# Altium project Fairing_Avionics_Interface.PrjPcb (part 1 of 2)
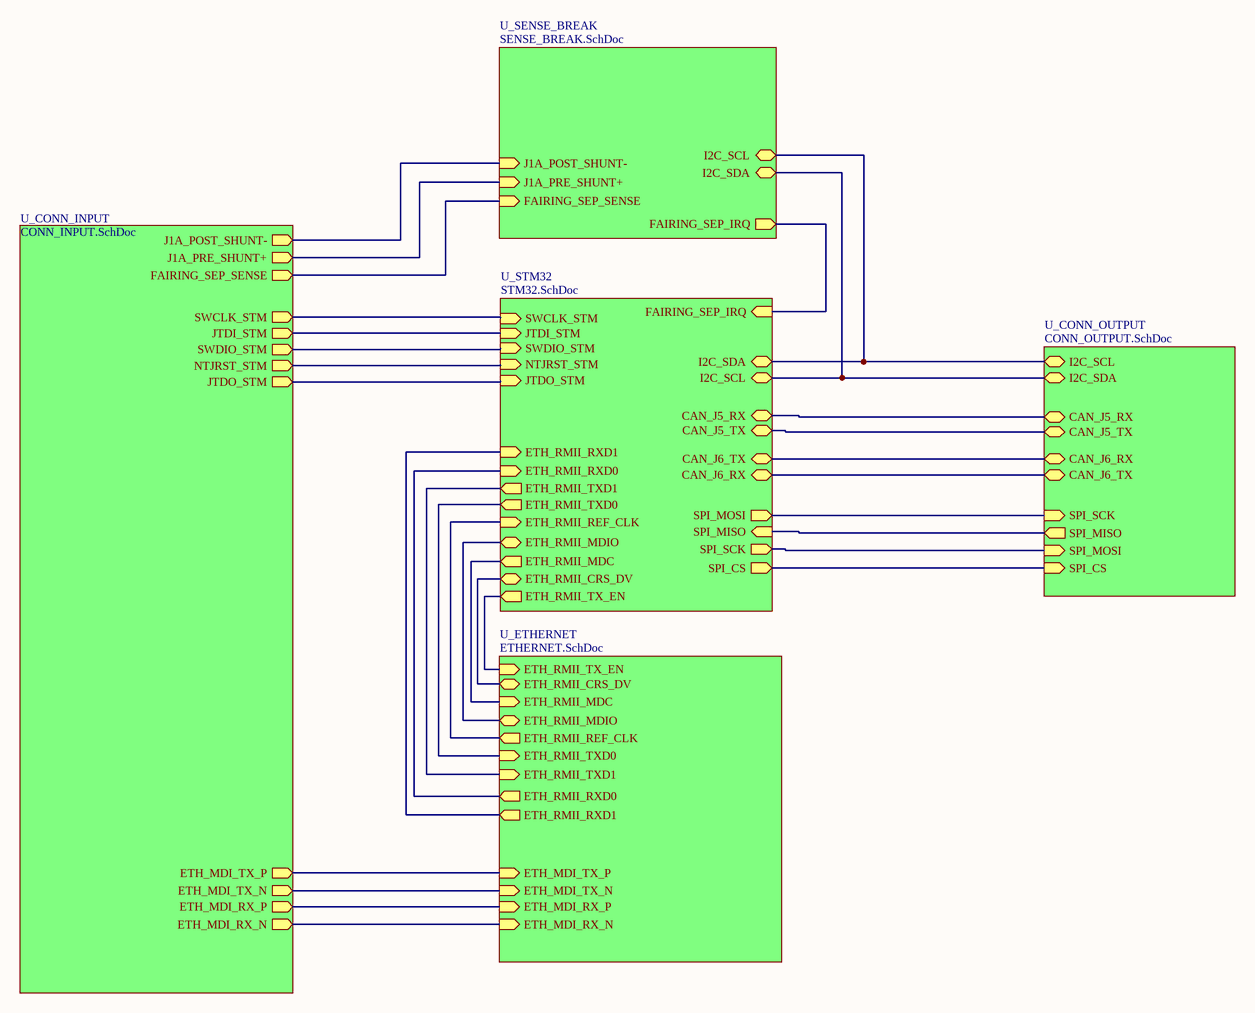
[diagram p0: [3]RootSheet.SchDoc]
6 sheets, 148 parts. Net scope: hierarchical (ports join the sheet entries above them; power ports are global).
Sheets:
  [3]RootSheet.SchDoc
    U_CONN_INPUT = CONN_INPUT.SchDoc
    U_ETHERNET = ETHERNET.SchDoc
    U_STM32 = STM32.SchDoc
    U_SENSE_BREAK = SENSE_BREAK.SchDoc
    U_CONN_OUTPUT = CONN_OUTPUT.SchDoc

## Sheet [3]RootSheet.SchDoc
size 431 x 279 mm; SheetNumber: 1; SheetTotal: 6

### Sub-sheets
U_CONN_INPUT = CONN_INPUT.SchDoc: FAIRING_SEP_SENSE (out), J1A_PRE_SHUNT+ (out), J1A_POST_SHUNT- (out), ETH_MDI_RX_N (out), ETH_MDI_RX_P (out), ETH_MDI_TX_N (out), ETH_MDI_TX_P (out), SWCLK_STM (out), JTDI_STM (out), SWDIO_STM (out), NTJRST_STM (out), JTDO_STM (out)
U_CONN_OUTPUT = CONN_OUTPUT.SchDoc: I2C_SCL (bidir), I2C_SDA (bidir), CAN_J5_TX (bidir), CAN_J5_RX (bidir), CAN_J6_RX (bidir), CAN_J6_TX (bidir), SPI_SCK (in), SPI_MISO (out), SPI_MOSI (in), SPI_CS (in)
U_ETHERNET = ETHERNET.SchDoc: ETH_RMII_TX_EN (in), ETH_MDI_TX_P (in), ETH_RMII_CRS_DV (bidir), ETH_RMII_MDIO (bidir), ETH_RMII_REF_CLK (out), ETH_RMII_TXD0 (in), ETH_RMII_TXD1 (in), ETH_MDI_RX_N (in), ETH_MDI_RX_P (in), ETH_MDI_TX_N (in), ETH_RMII_RXD0 (out), ETH_RMII_RXD1 (out), ETH_RMII_MDC (in)
U_SENSE_BREAK = SENSE_BREAK.SchDoc: I2C_SCL (bidir), J1A_PRE_SHUNT+ (in), J1A_POST_SHUNT- (in), FAIRING_SEP_SENSE (in), FAIRING_SEP_IRQ (out), I2C_SDA (bidir)
U_STM32 = STM32.SchDoc: FAIRING_SEP_IRQ (in), I2C_SDA (bidir), I2C_SCL (bidir), CAN_J5_TX (bidir), CAN_J6_RX (bidir), CAN_J6_TX (bidir), CAN_J5_RX (bidir), SPI_MOSI (out), SPI_SCK (out), SPI_CS (out), ETH_RMII_TX_EN (out), ETH_RMII_CRS_DV (bidir), ETH_RMII_MDC (out), ETH_RMII_MDIO (bidir), ETH_RMII_REF_CLK (in), ETH_RMII_TXD0 (out), ETH_RMII_TXD1 (out), ETH_RMII_RXD0 (in), ETH_RMII_RXD1 (in), SWCLK_STM (in), JTDI_STM (in), SWDIO_STM (in), NTJRST_STM (in), JTDO_STM (in), SPI_MISO (in)

### Nets
I2C_SCL: sheet U_STM32/I2C_SDA, sheet U_SENSE_BREAK/I2C_SCL, sheet U_CONN_OUTPUT/I2C_SCL
I2C_SDA: sheet U_STM32/I2C_SCL, sheet U_SENSE_BREAK/I2C_SDA, sheet U_CONN_OUTPUT/I2C_SDA
JTDO_STM: sheet U_CONN_INPUT/JTDO_STM, sheet U_STM32/JTDO_STM
NTJRST_STM: sheet U_CONN_INPUT/NTJRST_STM, sheet U_STM32/NTJRST_STM
NetC100_2: sheet U_CONN_INPUT/J1A_PRE_SHUNT+, sheet U_SENSE_BREAK/J1A_PRE_SHUNT+
NetC400_2: sheet U_STM32/FAIRING_SEP_IRQ, sheet U_SENSE_BREAK/FAIRING_SEP_IRQ
NetCR100_4: sheet U_CONN_INPUT/ETH_MDI_TX_N, sheet U_ETHERNET/ETH_MDI_TX_N
NetCR100_6: sheet U_CONN_INPUT/ETH_MDI_TX_P, sheet U_ETHERNET/ETH_MDI_TX_P
NetCR101_4: sheet U_CONN_INPUT/ETH_MDI_RX_N, sheet U_ETHERNET/ETH_MDI_RX_N
NetCR101_6: sheet U_CONN_INPUT/ETH_MDI_RX_P, sheet U_ETHERNET/ETH_MDI_RX_P
NetD101_2: sheet U_CONN_INPUT/FAIRING_SEP_SENSE, sheet U_SENSE_BREAK/FAIRING_SEP_SENSE
NetFB100_1: sheet U_CONN_INPUT/J1A_POST_SHUNT-, sheet U_SENSE_BREAK/J1A_POST_SHUNT-
NetJ9_2: sheet U_CONN_INPUT/SWDIO_STM, sheet U_STM32/SWDIO_STM
NetJ9_3: sheet U_CONN_INPUT/JTDI_STM, sheet U_STM32/JTDI_STM
NetJ9_5: sheet U_CONN_INPUT/SWCLK_STM, sheet U_STM32/SWCLK_STM
NetR302_1: sheet U_ETHERNET/ETH_RMII_TX_EN, sheet U_STM32/ETH_RMII_TX_EN
NetR304_2: sheet U_ETHERNET/ETH_RMII_RXD0, sheet U_STM32/ETH_RMII_RXD0
NetR305_1: sheet U_ETHERNET/ETH_RMII_TXD0, sheet U_STM32/ETH_RMII_TXD0
NetR306_2: sheet U_ETHERNET/ETH_RMII_RXD1, sheet U_STM32/ETH_RMII_RXD1
NetR307_1: sheet U_ETHERNET/ETH_RMII_TXD1, sheet U_STM32/ETH_RMII_TXD1
NetR308_1: sheet U_ETHERNET/ETH_RMII_CRS_DV, sheet U_STM32/ETH_RMII_CRS_DV
NetR309_1: sheet U_ETHERNET/ETH_RMII_MDIO, sheet U_STM32/ETH_RMII_MDIO
NetR602_1: sheet U_STM32/SPI_MOSI, sheet U_CONN_OUTPUT/SPI_SCK
NetR603_1: sheet U_STM32/SPI_MISO, sheet U_CONN_OUTPUT/SPI_MISO
NetR604_1: sheet U_STM32/SPI_SCK, sheet U_CONN_OUTPUT/SPI_MOSI
NetR605_1: sheet U_STM32/SPI_CS, sheet U_CONN_OUTPUT/SPI_CS
NetTP500_1: sheet U_ETHERNET/ETH_RMII_REF_CLK, sheet U_STM32/ETH_RMII_REF_CLK
NetU300_11: sheet U_ETHERNET/ETH_RMII_MDC, sheet U_STM32/ETH_RMII_MDC
NetU500_73: sheet U_STM32/CAN_J5_RX, sheet U_CONN_OUTPUT/CAN_J5_RX
NetU500_74: sheet U_STM32/CAN_J5_TX, sheet U_CONN_OUTPUT/CAN_J5_TX
NetU500_114: sheet U_STM32/CAN_J6_RX, sheet U_CONN_OUTPUT/CAN_J6_TX
NetU500_115: sheet U_STM32/CAN_J6_TX, sheet U_CONN_OUTPUT/CAN_J6_RX

## Sheet CONN_INPUT.SchDoc
size 558 x 431 mm; SheetNumber: 2; SheetTotal: 6; SPICEModelCacheBADTCNOH: <root> / <DocumentId>BADTCNOH</DocumentId> / </root>
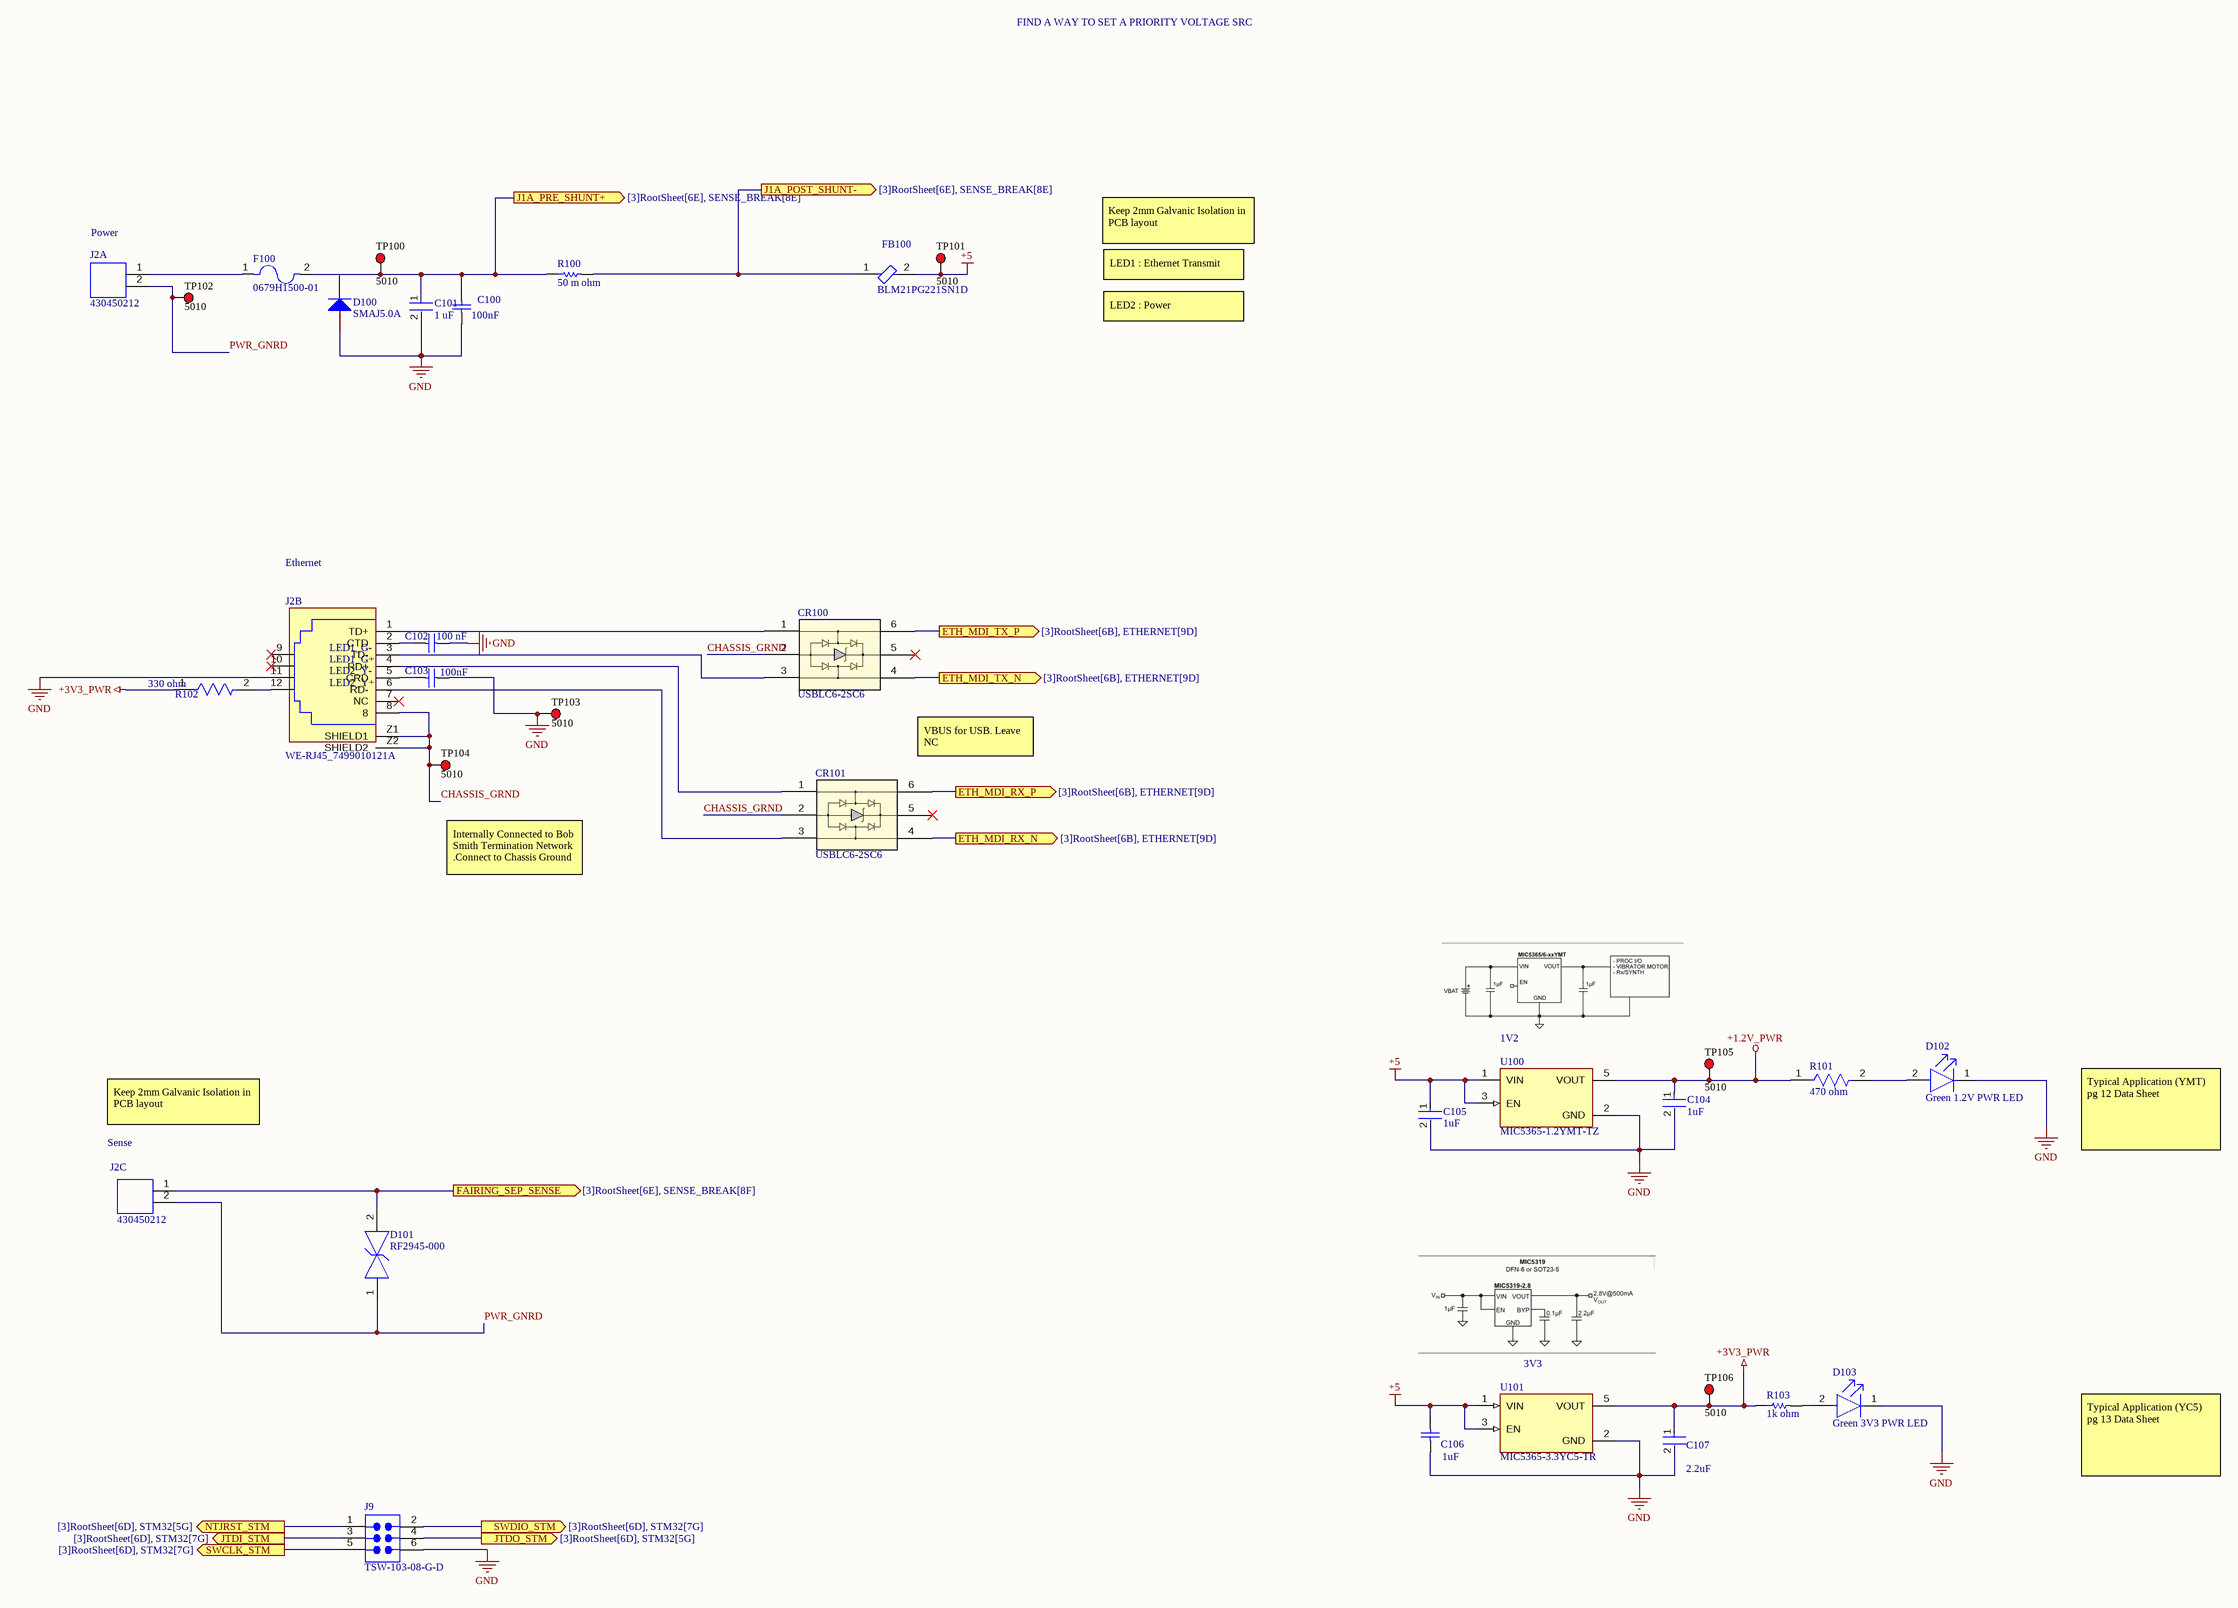
[diagram p1: CONN_INPUT.SchDoc]

### Parts
C100  100nF  [CAPC0603(1608)100_L]
C101  1 uF  [FP-GRM15-0_1-MFG]
C102  100 nF  [CAPC0603(1608)100_L]
C103  100nF  [CAPC0603(1608)100_L]
C104  1uF  [FP-GRM15-0_1-MFG]
C105  1uF  [FP-GRM15-0_1-MFG]
C106  1uF  [CAPC1005X55X10LL05]
C107  2.2uF  [FP-CC0603-DC-MFG]
CR100  USBLC6-2SC6  [SOT23-6L_STM]
CR101  USBLC6-2SC6  [SOT23-6L_STM]
D100  SMAJ5.0A  [BOUR-SMA-2_V]
D101  RF2945-000  [FP-SESD0402-MFG]
D102  Green 1.2V PWR LED  [FP-APHD1608LZGCK-MFG]
D103  Green 3V3 PWR LED  [FP-APHD1608LZGCK-MFG]
F100  0679H1500-01  [FUSC6125X279N]
FB100  BLM21PG221SN1D  [FP-BLM21-0_2-t0_85-e0_5-IPC_B]
J2A  430450212  [CONN_SD-43045-005_02_MOL]
J2B  WE-RJ45_7499010121A  [7499010121A]
J2C  430450212  [CONN_SD-43045-005_02_MOL]
J9  TSW-103-08-G-D  [SMTC-TSW-103-08-X-D]
R100  50 m ohm  [RESC3216X89X51LL25T25]
R101  470 ohm  [FP-RMCF0805-IPC_C]
R102  330 ohm  [FP-RMCF0603-MFG]
R103  1k ohm  [RESC2010(5025)_L]
TP100  5010  [KSTN-5010_V]
TP101  5010  [KSTN-5010_V]
TP102  5010  [KSTN-5010_V]
TP103  5010  [KSTN-5010_V]
TP104  5010  [KSTN-5010_V]
TP105  5010  [KSTN-5010_V]
TP106  5010  [KSTN-5010_V]
U100  MIC5365-1.2YMT-TZ  [TMLF-4_MCH]
U101  MIC5365-3.3YC5-TR  [TMLF-4_MCH]

### Ports
ETH_MDI_RX_N (out, see [3]RootSheet[6B], ETHERNET[9D]), ETH_MDI_RX_P (out, see [3]RootSheet[6B], ETHERNET[9D]), ETH_MDI_TX_N (out, see [3]RootSheet[6B], ETHERNET[9D]), ETH_MDI_TX_P (out, see [3]RootSheet[6B], ETHERNET[9D]), FAIRING_SEP_SENSE (out, see [3]RootSheet[6E], SENSE_BREAK[8F]), J1A_POST_SHUNT- (out, see [3]RootSheet[6E], SENSE_BREAK[8E]), J1A_PRE_SHUNT+ (out, see [3]RootSheet[6E], SENSE_BREAK[8E]), JTDI_STM (out, see [3]RootSheet[6D], STM32[7G]), JTDO_STM (out, see [3]RootSheet[6D], STM32[5G]), NTJRST_STM (out, see [3]RootSheet[6D], STM32[5G]), SWCLK_STM (out, see [3]RootSheet[6D], STM32[7G]), SWDIO_STM (out, see [3]RootSheet[6D], STM32[7G])

### Nets
+1.2V_PWR: C104.1 R101.1 TP105.1 U100.5(VOUT)
+3V3_PWR: C107.1 R102.1 R103.1 TP106.1 U101.5(VOUT)
+5: C105.1 C106.2 FB100.2 TP101.1 U100.1(VIN) U100.3(EN) U101.1(VIN) U101.3(EN)
GND: C100.1 C101.2 C102.1 C103.1 C104.2 C105.2 C106.1 C107.2 D100.1(A) D102.1(C) D103.1(C) J2B.11(LED2_Y-) J9.6 TP103.1 U100.2(GND) U101.2(GND)
CHASSIS_GRND: CR100.2 CR101.2 J2B.8 J2B.Z1(SHIELD1) J2B.Z2(SHIELD2) TP104.1
JTDO_STM: J9.4 ; port JTDO_STM
NTJRST_STM: J9.1 ; port NTJRST_STM
PWR_GNRD: D101.1 J2A.2 J2C.2 TP102.1
NetC100_2: C100.2 C101.1 F100.2 R100.1 TP100.1 ; port J1A_PRE_SHUNT+
NetC102_2: C102.2 J2B.2(CTD)
NetC103_2: C103.2 J2B.5(CRD)
NetCR100_1: CR100.1 J2B.1(TD+)
NetCR100_3: CR100.3 J2B.3(TD-)
NetCR100_4: CR100.4 ; port ETH_MDI_TX_N
NetCR100_6: CR100.6 ; port ETH_MDI_TX_P
NetCR101_1: CR101.1 J2B.4(RD+)
NetCR101_3: CR101.3 J2B.6(RD-)
NetCR101_4: CR101.4 ; port ETH_MDI_RX_N
NetCR101_6: CR101.6 ; port ETH_MDI_RX_P
NetD101_2: D101.2 J2C.1 ; port FAIRING_SEP_SENSE
NetD102_2: D102.2(A) R101.2
NetD103_2: D103.2(A) R103.2
NetF100_1: F100.1 J2A.1
NetFB100_1: FB100.1 R100.2 ; port J1A_POST_SHUNT-
NetJ2B_12: J2B.12(LED2_Y+) R102.2
NetJ9_2: J9.2 ; port SWDIO_STM
NetJ9_3: J9.3 ; port JTDI_STM
NetJ9_5: J9.5 ; port SWCLK_STM

Not connected (* = marked no-connect by the designer): CR100 5*; CR101 5*; D100 2(K); J2B 7(NC)* 9(LED1_G-)* 10(LED1_G+)*

### Notes on the sheet
- FIND A WAY TO SET A PRIORITY VOLTAGE SRC
- (near J2A) Power
- Keep 2mm Galvanic Isolation in PCB layout
- LED1 : Ethernet Transmit
- LED2 : Power
- Ethernet
- VBUS for USB. Leave NC
- Internally Connected to Bob Smith Termination Network .Connect to Chassis Ground
- (near U100) 1V2
- (near J2C) Sense
- Typical Application (YMT) pg 12 Data Sheet
- (near U101) 3V3
- Typical Application (YC5) pg 13 Data Sheet
- DWG. NO.
- REV.
- SHT.
- REVISION
- DESCRIPTION
- DATE
- APPROVED
- THIS DOCUMENT AND THE DATA DISCLOSED HEREIN OR HEREWITH IS THE PROPERTY OF ALTIUM LIMITED AND MAY BE FREELY DISTRIBUTED IN WHOLE. NO RIGHTS ARE RESERVED OR EXPRESS OR IMPLIED WARANTEE GIVEN.
- ENG:
- DSN:
- APPROVALS
- PROJECT
- DOCUMENT REVISION:
- DESIGN ITEM:
- CHK:
- BOM:
- REFERENCE DOCUMENTS
- PROJECT REVISION:
- TITLE
- FAB DWG:
- PCB DWG:
- ASSY DWG:
- SCALE:
- SIZE
- C
- CAGE CODE
- FILE NAME
- DWG NO.
- SHEET
- OF
- REV

### Library data of the parts
C100 C102 C103 = CMP-1035-02591-1: CAP 100nF 50V ±5% 0603 (1608 Metric) Thickness 1mm SMD; Tolerance: Â±5%; Case-Metric: 1608; Case-EIA: 0603; Rated Voltage: 50 V; Max Thickness: 1 mm; Technology: SMT; Value: 100nF
C101 C104 C105 = CMP-2008-04556-2: CAP CER 1UF 10V X5R 0402; Manufacturer Part Number: GRM155R61A105KE15D; Manufacturer: Murata; Material: Ceramic; Tolerance: 10%; Temperature Coefficient: 15%; Octopart: https://octopart.com/grm155r61a105ke15d-murata-197442; Lead Free: Yes; ComponentLink2Description: Datasheet; Temperature: -55°C to +85°C; Temperature Range High: +85°C; Height: 0.55mm; Capacitance: 1uF; Ipc Land Pattern Name: CAPC10050X50; ComponentLink2URL: https://search.murata.co.jp/Ceramy/image/img/A01X/G101/ENG/GRM155R61A105KE15-01A.pdf; Temperature Range Low: -55°C; Device Class L2: Capacitors; Voltage Rating: 10V; RoHS: TRUE; Device Class L1: Passive Components; Device Class L3: Ceramic Capacitors; Temperature Characteristic: X5R; Mouser Description: 0402 1 uF 10 V ±10% Tolerance X5R Surface Mount Multilayer Ceramic Capacitor; Automotive: No; Package: GRM15-0.1; Digikey Description: CAP CER 1UF 10V X5R 0402; Value: 1uF; Category: Cap
C106 = CMP-2000-05996-1: Multilayer Ceramic Chip Capacitor, 1 uF, +/- 10%, 10 V, -55 to 85 degC, 0402 (1005 Metric), RoHS, Tape and Reel; Manufacturer: TDK; PCN Part Number: MLCCPartNumberChange30/Nov/2012; Product Training Modules: CSeriesGeneralApplicationsSEAT,CCV,andTVCLDesignToolsGuidetoReplacinganElectrolyticCapacitorwithanMLCC; Voltage - Rated: 10V; Temperature Coefficient: X5R; Online Catalog: CSeries,GeneralPurpose; Capacitance: 1µF; Other Names: 445-4114-6; Category: Capacitors; Features: -; Lead Style: -; RoHS Information: RoHSCertificate-MLCC; Manufacturer URL: http://www.tdk.com/; Lead Spacing: -; Thickness (Max): 0.022"(0.55mm); Applications: GeneralPurpose; Tolerance: ±10%; Mounting Technology: SurfaceMount; Mounting Type: SurfaceMount,MLCC; Operating Temperature: -55°C~85°C; Datasheet URL: http://download.siliconexpert.com/pdfs/2015/4/21/15/54/45/779/tdk_/manual/37024850441143360mlcc_commercial_general_en.pdf; Package Reference: 1005; Height - Seated (Max): -; Family: CeramicCapacitors; Datasheet Version: 03/2015; Package Description: 2-Pin Surface Mount Device, Body 1 x 0.5 mm; Packaging: Digi-Reel®; Size / Dimension: 0.039"Lx0.020"W(1.00mmx0.50mm); Standard Package: 1; Package / Case: 0402(1005Metric); Ratings: -; Series: C
C107 = CMP-03422-000578-2: CAP CER 2.2UF 50V X5R 0603; Tolerance: 10%; Packaging: Cut Tape; Capacitance: 2.2uF; Min Operating Temperature: -55°C; RoHS Compliant: Yes; Max Operating Temperature: 85°C; Case Code (Metric): 1608; Voltage Rating: 50V; Case/Package: 0603; Case Code (Imperial): 0603; Mount: Surface Mount
CR100 CR101 = USBLC6-2SC6: ESD Protection for USB 2.0 High Speed; Manufacturer_Name: STMicroelectronics; Copyright: Copyright (C) 2025 Ultra Librarian. All rights reserved.; Manufacturer_Part_Number: USBLC6-2SC6; RefDes: RefDes; Type: Type
D100 = CMP-2000-07090-1: SMAJ Transient Voltage Suppressor Diode Series, 3.5 V, -55 to 150 degC, 2-Pin SMA, RoHS, Tape and Reel; Manufacturer: Bourns; EDA / CAD Models: DownloadfromAcceleratedDesigns; Unidirectional Channels: 1; Voltage - Breakdown (Min): 6.4V; Voltage - Reverse Standoff (Typ): 5V; Voltage - Clamping (Max) @ Ipp: 9.2V; Other Names: SMAJ5.0ABDKR; Type: Zener; Catalog Drawings: SMAJSeriesFootprintSMAJ,SMBJSeries; Featured Product: SMAJ/SMBJ/SMCJ/SMLJDiscreteTVSDiodes; Power - Peak Pulse: 400W; Current - Peak Pulse (10/1000µs): 43.5A; Power Line Protection: No; Online Catalog: SMAJSeries; Supplier Device Package: SMA(DO-214AC); Operating Temperature: -55°C~150°C(TJ); Package Description: 2-Pin Surface Mount Device, Body 4.315 x 2.605 mm; Datasheet URL: https://datasheet.ciiva.com/25624/0900766b8112213b-25624680.pdf; Manufacturer URL: http://www.bourns.com/; Datasheet Version: 08/2012; Series: SMAJ; Family: TVS-Diodes; Bidirectional Channels: -; Applications: GeneralPurpose; Package Reference: SMA-2; Standard Package: 1; Package / Case: DO-214AC,SMA; Category: CircuitProtection; RoHS Information: SMAJSeriesMaterialDeclaration; Mounting Technology: SurfaceMount; Capacitance @ Frequency: -; Packaging: Digi-Reel®; Mounting Type: SurfaceMount
D101 = CMP-08607-000062-1: TVS DIODE 7V 10V 0402; Manufacturer: Littelfuse; Value: 0.1pF; Breakdown Voltage: 9.8V; Number Of Channels: 1; Peak Pulse Current: 2A; Direction: Bidirectional; Automotive Grade: Grade 1; Standoff Height: 0mm; Octopart: https://octopart.com/rf2945-000-littelfuse-56516902; Device Class L3: unset; ComponentLink2Description: Datasheet; Lead Free: Yes; Temperature Range Low: -55°C; Clamping Voltage: 10V; Digikey Description: TVS DIODE 7V 10V 0402; Category: Diode; Temperature: -55°C to +125°C; Device Class L1: Circuit Protection; Capacitance: 0.1pF; RoHS: TRUE; Device Class L2: TVS Diodes; Package: SESD0402; Reverse Standoff Voltage: 7V; Automotive: Yes; Height: 0.43mm; Manufacturer Part Number: RF2945-000; Temperature Range High: +125°C; ComponentLink2URL: https://www.littelfuse.com/~/media/electronics/datasheets/tvs_diode_arrays/littelfuse_tvs_diode_array_sesd_ultra_low_capacitance_discrete_tvs_datasheet.pdf.pdf
D102 D103 = CMP-44529-000045-1: LED GREEN CLEAR 1608 SMD; Test Current: 2mA; Dominant Wavelength: 525nm; Lens Color: Colorless; Luminous Intensity: 180mcd; Viewing Angle: 100°; Forward Voltage: 2.65V; Lens Size: 0.7mm; Lens Style: Round; Mount: Surface Mount; Packaging: Tape and Reel; Lens Transparency: Clear; Height: 0.75mm; Case/Package: 0603; Length: 1.6mm; Case Code (Metric): 1608; Width: 0.8mm; Color: Green; Case Code (Imperial): 0603
F100 = 0679H1500-01: 2410 SMT Fuse | Quick Acting | 250mA | Higher AC Voltage; Package: None; Price: None; Value: *; MP: 0679H1500-01; Availability: Unavailable
FB100 = CMP-0686-00610-3: Chip Ferrite Bead, 0805, 220Ω @ 100MHz, 0.045Ω, 25%, 2A; Number of Circuits: 1; Shielding: Unshielded; DC Resistance (DCR): 45mR; Impedance: 220R; Radiation Hardening: No; Material: Ferrite; Frequency: 100MHz; Width: 1.25mm; DC Current: 2A; Max DC Current: 2A; Number of Lines: 1; Package Quantity: 1; Case Code (Metric): 2012; Current Rating: 2A; Case/Package: 0805; Current: 2A; Military Standard: Not; Core Material: Ferrite; Depth: 1.25mm; Contact Plating: Tin; DC Resistance-Max: 45mR; Max Operating Temperature: 125°C; Length: 2mm; Max Current Rating: 2A; REACH SVHC: No SVHC; Termination: SMD/SMT; Min Operating Temperature: -55°C; Series: BLM21P; Test Frequency: 100MHz; Tolerance: 25%; Number of Pins: 2; RoHS Compliant: Yes; Height: 0.85mm; Packaging: Tape and Reel; Lead Free: Lead Free; Case Code (Imperial): 0805
J2A J2C = 430450212: Connector Header Through Hole 2 position; MF: Molex; SnapEDA_Link: https://www.snapeda.com/parts/430450212/Molex/view-part/?ref=snap; Package: None; Value: *; MP: 430450212; Check_prices: https://www.snapeda.com/parts/430450212/Molex/view-part/?ref=eda
J2B = WE-RJ45_7499010121A: MF: {'manufacturer': u'Wurth Electronics'}; Package: None; Price: None; Value: *; MP: 7499010121A; Availability: Unavailable
J9 = CMP-1024-00338-1: 0.025" SQ Post Header, Through-hole, Vertical, -55 to 125 degC, 2.54 mm Pitch, 6-Pin, Male, RoHS; Manufacturer: Samtec; Pitch: 2.54 mm; ComponentLink1URL: http://www.samtec.com; ComponentLink2URL: http://www.samtec.com/documents/webfiles/pdf/TSW_TH.PDF; Temperature Range: -55 to 125 degC; RoHS: True; ComponentLink2Description: Datasheet; PackageReference: TSW-103-08-X-D; ComponentLink3Description: Package Specification; PackageDescription: .025[0.64] SQ. Post Terminal Strip Assembly; DatasheetVersion: F-214; Mounting Technology: Through-hole; ComponentLink1Description: Manufacturer URL; Orientation: Vertical; PartNumber: TSW-103-08-G-D; PackageVersion: DM, 8/1988; ComponentLink3URL: http://www.samtec.com/documents/webfiles/cpdf/TSW-XXX-XX-XXX-X-XX-XXX-MKT.pdf
R100 = CMP-2003-04361-1: Manufacturer: Vishay Dale; Part Number: WSL1206R0500FEA
R101 = CMP-26527-003746-1: 470Ω ±1% 0.125W 0805 Thick Film Chip Resistor AEC-Q200 compliant; Resistance: 470R; Temperature Coefficient: 100ppm/°C; Max Power Dissipation: 125mW; Resistor Type: Thick Film; Number of Terminations: 2; Packaging: Tape and Reel; RoHS Compliant: Yes; Case/Package: 0805; Mount: Surface Mount; Contact Plating: Tin; Series: RMCF; Min Operating Temperature: -55°C; Radiation Hardening: No; Features: Automotive AEC-Q200; Tolerance: 1%; Max Operating Temperature: 155°C
R102 = CMP-26527-002055-1: 220Ω ±5% 0.1W 0603 Thick Film Chip Resistor AEC-Q200 compliant; Resistance: 220R; Temperature Coefficient: 100ppm/°C; Min Operating Temperature: -55°C; Contact Plating: Tin; Max Operating Temperature: 155°C; Radiation Hardening: No; Tolerance: 5%; RoHS Compliant: Yes; Packaging: Tape and Reel; Mount: Surface Mount; Case/Package: 0603; Resistor Type: Thick Film
R103 = CMP-1017-00074-1: 1K 0.75W 5% 2010 (5025 Metric)  SMD; Case-EIA: 2010; Value: 1000.00 Ohm; Case-Metric: 5025; Technology: SMT; Tolerance: 5 %; Power: 0.75 W
TP100-TP106 = CMP-1672-00002-4: Test Point, Red, Through Hole, RoHS, Bulk; Manufacturer: Keystone; Contact Material: Bronze; Mounting Technology: Through Hole; RoHSCompliant: true; Pins: 1; Package Quantity: 100; ComponentLink2Description: Datasheet; Height: 8.12 mm; ComponentLink1URL: http://www.keyelco.com/; DatasheetVersion: Rev. F, 12/2013; Mount: Through Hole; PackageReference: 5010; Contact Plating: Silver; Packaging: Bulk; Colour: Red; REACH SVHC: No SVHC; PackageDescription: 1-Pin Through Hole Device, Dia 3.17 mm; ComponentLink2URL: http://www.keyelco.com/product-pdf.cfm?p=1319; ComponentLink1Description: Manufacturer URL
U100 = MIC5365-1.2YMT-TZ: No Description Available; Manufacturer_Name: Microchip; Copyright: Copyright (C) 2026 Ultra Librarian. All rights reserved.; Manufacturer_Part_Number: MIC5365-1.2YMT-TZ; RefDes: RefDes; Type: Type
U101 = MIC5365-3.3YC5-TR: Linear Voltage Regulator IC Positive Fixed 1 Output 150mA SC-70-5; MF: Microchip; SnapEDA_Link: https://www.snapeda.com/parts/MIC5365-3.3YC5-TR/Microchip/view-part/?ref=snap; Package: SC-70-5 Microchip; Value: *; MP: MIC5365-3.3YC5-TR; Check_prices: https://www.snapeda.com/parts/MIC5365-3.3YC5-TR/Microchip/view-part/?ref=eda

## Sheet ETHERNET.SchDoc
size 558 x 431 mm; SheetNumber: 3; SheetTotal: 6; SPICEModelCacheANLGLSFY: <root> / <DocumentId>ANLGLSFY</DocumentId> / </root>
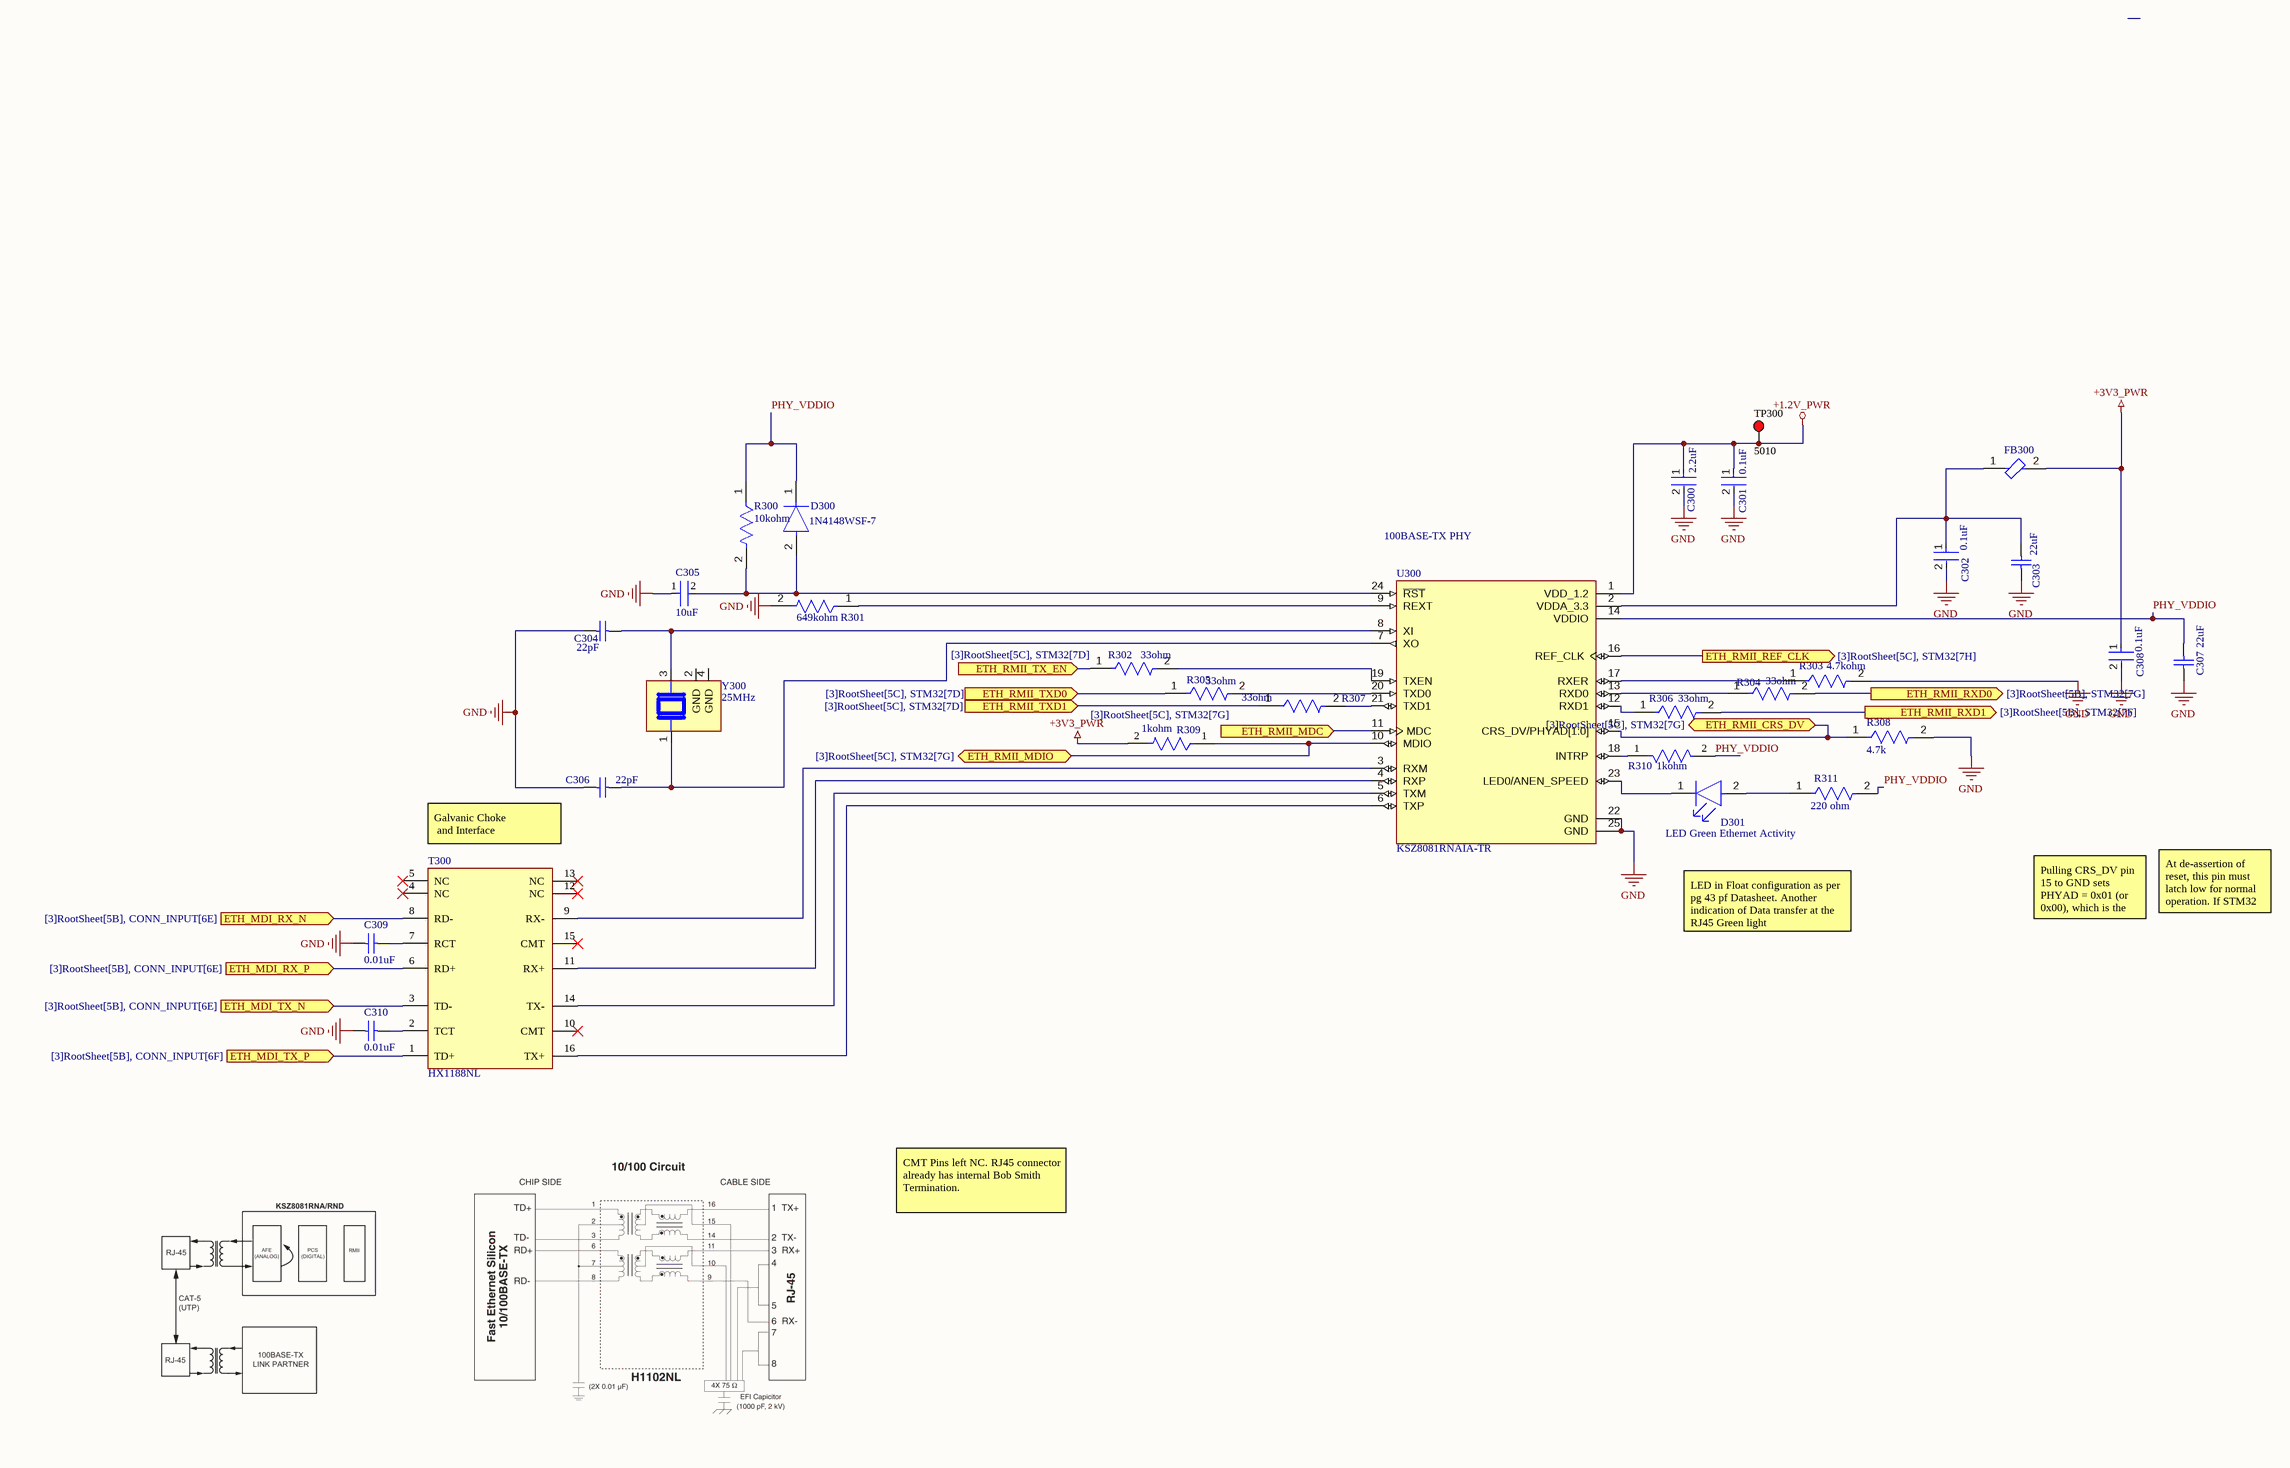
[diagram p2: ETHERNET.SchDoc]

### Parts
C300  2.2uF  [FP-CC0603-DC-MFG]
C301  0.1uF  [FP-GCM188-0_1-IPC_A]
C302  0.1uF  [FP-GCM188-0_1-IPC_A]
C303  22uF  [CAPC1608X90X35ML15T15]
C304  22pF  [CAPC1608X87X35LL15T15]
C305  10uF  [FP-CC0603-DC-MFG]
C306  22pF  [CAPC1608X87X35LL15T15]
C307  22uF  [CAPC1608X90X35ML15T15]
C308  0.1uF  [FP-GCM188-0_1-IPC_A]
C309  0.01uF  [CAPC0603(1608)100_L]
C310  0.01uF  [CAPC0603(1608)100_L]
D300  1N4148WSF-7  [FP-SOD323F-MFG]
D301  LED Green Ethernet Activity  [FP-APHD1608LZGCK-MFG]
FB300  BLM18PG121SN1D  [FP-BLM18-0_15-t0_8-IPC_A]  (value not drawn)
R300  10kohm  [FP-RC0603-0_55-IPC_C]
R301  649kohm  [FP-RT0603-MFG]
R302  33ohm  [FP-CRGCQ0603-IPC_C]
R303  4.7kohm  [FP-RMCF0603-IPC_B]
R304  33ohm  [FP-CRGCQ0603-IPC_C]
R305  33ohm  [FP-CRGCQ0603-IPC_C]
R306  33ohm  [FP-CRGCQ0603-IPC_C]
R307  33ohm  [FP-CRGCQ0603-IPC_C]
R308  4.7k  [FP-RMCF0603-IPC_B]
R309  1kohm  [FP-TFCR0603-MFG]
R310  1kohm  [FP-TFCR0603-MFG]
R311  220 ohm  [FP-RMCF0603-MFG]
T300  HX1188NL  [FP-HX1188NL-MFG]
TP300  5010  [KSTN-5010_V]
U300  KSZ8081RNAIA-TR  [QFN50P400X400X90-25N]
Y300  25MHz  [XTAL_C3E-25.000-12-3030-X-R]

### Ports
ETH_MDI_RX_N (in, see [3]RootSheet[5B], CONN_INPUT[6E]), ETH_MDI_RX_P (in, see [3]RootSheet[5B], CONN_INPUT[6E]), ETH_MDI_TX_N (in, see [3]RootSheet[5B], CONN_INPUT[6E]), ETH_MDI_TX_P (in, see [3]RootSheet[5B], CONN_INPUT[6F]), ETH_RMII_CRS_DV (bidir, see [3]RootSheet[5C], STM32[7G]), ETH_RMII_MDC (in, see [3]RootSheet[5C], STM32[7G]), ETH_RMII_MDIO (bidir, see [3]RootSheet[5C], STM32[7G]), ETH_RMII_REF_CLK (out, see [3]RootSheet[5C], STM32[7H]), ETH_RMII_RXD0 (out, see [3]RootSheet[5B], STM32[7G]), ETH_RMII_RXD1 (out, see [3]RootSheet[5B], STM32[7F]), ETH_RMII_TX_EN (in, see [3]RootSheet[5C], STM32[7D]), ETH_RMII_TXD0 (in, see [3]RootSheet[5C], STM32[7D]), ETH_RMII_TXD1 (in, see [3]RootSheet[5C], STM32[7D])

### Nets
+1.2V_PWR: C300.1 C301.1 TP300.1 U300.1(VDD_1.2)
+3V3_PWR: C308.1 FB300.2 R309.2
GND: C300.2 C301.2 C302.2 C303.1 C304.1 C305.1 C306.1 C307.1 C308.2 C309.1 C310.1 R301.2 R303.2 R308.2 U300.22(GND) U300.25(GND)
PHY_VDDIO: C307.2 D300.1(C) R300.1 R310.2 R311.2 U300.14(VDDIO)
NetC302_1: C302.1 C303.2 FB300.1 U300.2(VDDA_3.3)
NetC304_2: C304.2 U300.8(XI) Y300.3
NetC305_2: C305.2 D300.2(A) R300.2 U300.24(~{RST})
NetC306_2: C306.2 U300.7(XO) Y300.1
NetC309_2: C309.2 T300.7(RCT)
NetC310_2: C310.2 T300.2(TCT)
NetCR100_4: T300.3(TD-) ; port ETH_MDI_TX_N
NetCR100_6: T300.1(TD+) ; port ETH_MDI_TX_P
NetCR101_4: T300.8(RD-) ; port ETH_MDI_RX_N
NetCR101_6: T300.6(RD+) ; port ETH_MDI_RX_P
NetD301_1: D301.1(C) U300.23(LED0/ANEN_SPEED)
NetD301_2: D301.2(A) R311.1
NetR301_1: R301.1 U300.9(REXT)
NetR302_1: R302.1 ; port ETH_RMII_TX_EN
NetR302_2: R302.2 U300.19(TXEN)
NetR303_1: R303.1 U300.17(RXER)
NetR304_1: R304.1 U300.13(RXD0)
NetR304_2: R304.2 ; port ETH_RMII_RXD0
NetR305_1: R305.1 ; port ETH_RMII_TXD0
NetR305_2: R305.2 U300.20(TXD0)
NetR306_1: R306.1 U300.12(RXD1)
NetR306_2: R306.2 ; port ETH_RMII_RXD1
NetR307_1: R307.1 ; port ETH_RMII_TXD1
NetR307_2: R307.2 U300.21(TXD1)
NetR308_1: R308.1 U300.15(CRS_DV/PHYAD[1:0]) ; port ETH_RMII_CRS_DV
NetR309_1: R309.1 U300.10(MDIO) ; port ETH_RMII_MDIO
NetR310_1: R310.1 U300.18(INTRP)
NetT300_9: T300.9(RX-) U300.3(RXM)
NetT300_11: T300.11(RX+) U300.4(RXP)
NetT300_14: T300.14(TX-) U300.5(TXM)
NetT300_16: T300.16(TX+) U300.6(TXP)
NetTP500_1: U300.16(REF_CLK) ; port ETH_RMII_REF_CLK
NetU300_11: U300.11(MDC) ; port ETH_RMII_MDC

Not connected (* = marked no-connect by the designer): T300 4(NC)* 5(NC)* 10(CMT)* 12(NC)* 13(NC)* 15(CMT)*; Y300 2(GND) 4(GND)

### Notes on the sheet
- 100BASE-TX PHY
- (near C308) Type @ to refer to a designator
- Galvanic Choke
  and Interface
- Pulling CRS_DV pin 15 to GND sets PHYAD = 0x01 (or 0x00), which is the standard default address expected by the STM32 Ethernet driver library (HAL/LwIP)
- At de-assertion of reset, this pin must latch low for normal operation. If STM32 does not use RXER, tie to GND via a 4.7k ohm resistor.
- LED in Float configuration as per pg 43 pf Datasheet. Another indication of Data transfer at the RJ45 Green light
- CMT Pins left NC. RJ45 connector already has internal Bob Smith Termination.
- DWG. NO.
- REV.
- SHT.
- REVISION
- DESCRIPTION
- DATE
- APPROVED
- THIS DOCUMENT AND THE DATA DISCLOSED HEREIN OR HEREWITH IS THE PROPERTY OF ALTIUM LIMITED AND MAY BE FREELY DISTRIBUTED IN WHOLE. NO RIGHTS ARE RESERVED OR EXPRESS OR IMPLIED WARANTEE GIVEN.
- ENG:
- DSN:
- APPROVALS
- PROJECT
- DOCUMENT REVISION:
- DESIGN ITEM:
- CHK:
- BOM:
- REFERENCE DOCUMENTS
- PROJECT REVISION:
- TITLE
- FAB DWG:
- PCB DWG:
- ASSY DWG:
- SCALE:
- SIZE
- C
- CAGE CODE
- FILE NAME
- DWG NO.
- SHEET
- OF
- REV

### Library data of the parts
C300 = CMP-03422-000578-2: as C107 on sheet CONN_INPUT; Packaging: Cut Tape; Capacitance: 2.2uF; Min Operating Temperature: -55°C; RoHS Compliant: Yes; Max Operating Temperature: 85°C; Case Code (Metric): 1608; Voltage Rating: 50V; Case/Package: 0603; Case Code (Imperial): 0603; Mount: Surface Mount
C301 C302 C308 = CMP-2006-02355-2: CAP CER 0.1UF 16V X7R 0603; Tolerance: 10%; Capacitance: 100nF; Thickness: 0.035inch; Lead Free: Lead Free; Dielectric: X7R; Case Code (Metric): 1608; Voltage Rating: 16V; Depth: 0.8mm; Height: 0.8mm; RoHS Compliant: Yes; Termination: SMD/SMT; Case/Package: 0603; Case Code (Imperial): 0603; Package Quantity: 4000; Voltage: 16V; Radiation Hardening: No; Series: GCM; Length: 1.6mm; Mount: Surface Mount; Construction: Flat; Ratings: AEC-Q200; Min Operating Temperature: -55°C; Packaging: Tape and Reel; Voltage Rating (DC): 16V; Max Operating Temperature: 125°C; Width: 0.031inch; REACH SVHC: No SVHC
C303 C307 = CMP-2006-04205-1: Manufacturer: AVX Interconnect / Elco; Part Number: 06034D226MAT2A
C304 C306 = CMP-2006-03615-1: Manufacturer: Kemet; Part Number: C0603X220J5GACTU
C305 = CMP-00621-81932632-1: CC0603KRX5R7BB106 Multilayer Ceramic Capacitor, 10 uF, 16 V, ± 10%, X5R, 0603 [1608 Metric]; Capacitance: 10µF; Voltage Rating: 16V; NexarPartId: 81932632; Height: 1mm; Halogen Free: Halogen Free; Dielectric: X5R; Max Operating Temperature: 85°C; Voltage Rating (DC): 16V; Material: Ceramic; Lead Free: Lead Free; Tolerance: 10%; RoHS: Non-Compliant; Min Operating Temperature: -55°C; Case/Package: 0603
C309 C310 = CMP-1035-02591-1: as C100 on sheet CONN_INPUT; Rated Voltage: 50 V; Max Thickness: 1 mm; Technology: SMT; Value: 100nF
D300 = CMP-12791-000029-1: DIODE GEN PURP 100V 250MA SOD323; Manufacturer: Diodes Inc.; Value: 1.5pF; Max Surge Forward Current: 0.5A; Peak Reverse Current: 0.5uA; Max Junction Temp: +150°C; Height: 0.75mm; Digikey Description: DIODE GEN PURP 100V 250MA SOD323; Automotive: No; Footprint Url: https://www.diodes.com/assets/Package-Files/SOD323F.pdf; Category: Diode; Manufacturer Part Number: 1N4148WSF-7; Max Repetitive Reverse Voltage: 100V; Lead Free: Yes; Temperature Range High: +150°C; Forward Current: 250mA; Reverse Voltage: 100V; Device Class L3: Rectifier Diodes; ComponentLink2URL: https://www.diodes.com/assets/Datasheets/1N4148WSF.pdf; Package: SOD323F; RoHS: TRUE; Mouser Description: Diodes - General Purpose, Power, Switching 200mW 2pF 75Vrrm 150mA 2A 1VF; Temperature: -55°C to +150°C; Capacitance: 1.5pF; Device Class L2: Diodes; ComponentLink2Description: Datasheet; Device Class L1: Discrete Semiconductors; Octopart: https://octopart.com/1n4148wsf-7-diodes+inc.-33798544; Temperature Range Low: -55°C
D301 = CMP-44529-000045-1: as D102 on sheet CONN_INPUT; Mount: Surface Mount; Packaging: Tape and Reel; Lens Transparency: Clear; Height: 0.75mm; Case/Package: 0603; Length: 1.6mm; Case Code (Metric): 1608; Width: 0.8mm; Color: Green; Case Code (Imperial): 0603
FB300 = CMP-0686-00557-7: Chip Ferrite Bead, 0603, 120Ω @ 100MHz, 0.05Ω, 25%, 2A; Impedance: 120R; Number of Circuits: 1; Shielding: Unshielded; Material: Steel; DC Resistance (DCR): 50mR; Case Code (Imperial): 0603; RoHS Compliant: Yes; Number of Pins: 2; Min Operating Temperature: -55°C; Case Code (Metric): 1608; Frequency: 100MHz; Length: 1.6mm; Test Frequency: 100MHz; Max Operating Temperature: 125°C; Packaging: Tape and Reel; Max Current Rating: 2A; Termination: SMD/SMT; Lead Free: Lead Free; Max DC Current: 2A; Case/Package: 0603; Height: 0.8mm; Current Rating: 2A; Radiation Hardening: No; Core Material: Ferrite; DC Current: 2A; REACH SVHC: No SVHC; Package Quantity: 1; Depth: 0.8mm; Number of Lines: 1; Tolerance: 25%; Width: 0.8mm
R300 = CMP-2100-03664-2: RES 10K OHM 1% 1/10W 0603; Voltage Rating: 75V; Voltage Rating (DC): 50V; Resistance: 10kR; Power Rating: 100mW; Temperature Coefficient: 100ppm/°C; Depth: 0.8mm; Termination: SMD/SMT; Resistor Type: Thick Film; Series: RC; Construction: Rectangular; Features: Moisture Resistant; Packaging: Tape and Reel; Min Operating Temperature: -55°C; Number of Terminations: 2; Lead Pitch: 0.3mm; RoHS Compliant: Yes; Case/Package: 0603; Resistance Tolerance: 1%; Military Standard: Not; Weight: 7.1E-05oz; Number of Pins: 2; Tolerance: 1%; Length: 1.6mm; Case Code (Imperial): 0603; Lead Free: Lead Free; Width: 0.8mm; Max Power Dissipation: 100mW; Height: 0.45mm; Max Operating Temperature: 155°C; Case Code (Metric): 1608; Size Code: 0603
R301 = CMP-03412-015599-1: RES SMD 649K OHM 0.1% 1/10W 0603; Manufacturer Part Number: RT0603BRD07649KL; Manufacturer: Yageo; Temperature Coefficient: 25 ppm/°C; Tolerance: 0.001; Resistance: 649KΩ; Power Rating: 0.1W; Value: 649KΩ; Voltage Rating: 75V; Composition: Thin Film; Temperature Range Low: -55°C; Lead Free: Yes; Device Class L1: Passive Components; Digikey Description: RES SMD 649K OHM 0.1% 1/10W 0603; Octopart: https://octopart.com/rt0603brd07649kl-yageo-71394375; Package: RT0603; Series: RT; Temperature Range High: +155°C; Mouser Description: Thin Film Resistors 1/10W 649K ohm .1% 25ppm; Height: 0.55mm; Automotive: No; RoHS: TRUE; ComponentLink2URL: http://www.yageo.com/documents/recent/PYu-RT_1-to-0.01_RoHS_L_9.pdf; Device Class L2: Resistors; Footprint Url: http://www.yageo.com/exep/pages/download/literatures/PYu-R_Mount_10.pdf; Category: Res; Ipc Land Pattern Name: RESC16080X45; Temperature: -55°C to +155°C; ComponentLink2Description: Datasheet; Device Class L3: Chip SMD Resistors
R302 R304-R307 = CMP-03211-000637-1: CRGCQ0603 33Ω 5% ±200ppm/°C 75V; Manufacturer: TE Connectivity; Manufacturer Part Number: CRGCQ0603J33R; Power Rating: 0.1W; Tolerance: 0.05; Series: CRGCQ; Temperature Range Low: -55°C; Device Class L2: Resistors; Voltage Rating: 75V; Package: CRGCQ0603; Value: 33Ω; Height: 0.55mm; Lead Free: Yes; Ambient Temperature Range High: +70°C; Resistance: 33Ω; ComponentLink2Description: Datasheet; Category: Res; Ipc Land Pattern Name: RESC16080X45; Composition: Thick Film; Device Class L3: Chip SMD Resistors; Temperature Range High: +155°C; Octopart: https://octopart.com/crgcq0603j33r-te+connectivity-91018120; Device Class L1: Passive Components; Temperature Coefficient: ±200ppm/°C; Temperature: -55°C to +155°C; RoHS: TRUE; ComponentLink2URL: https://www.te.com/commerce/DocumentDelivery/DDEController?Action=showdoc&DocId=Data+Sheet%7F1773204-3%7F1%7Fpdf%7FEnglish%7FENG_DS_1773204-3_1.pdf%7F4-2176339-353
R303 R308 = CMP-26527-004068-1: 4.7kΩ ±1% 0.1W 0603 Thick Film Chip Resistor AEC-Q200 compliant; Resistance: 4.7kR; Temperature Coefficient: 100ppm/°C; Max Power Dissipation: 100mW; Length: 0.061inch; Tolerance: 1%; Series: RMCF; Resistor Type: Thick Film; Packaging: Tape and Reel; Features: Automotive AEC-Q200; Max Operating Temperature: 155°C; Number of Terminations: 2; RoHS Compliant: Yes; Case/Package: 0603; Width: 0.031inch; Height: 0.022inch; Min Operating Temperature: -55°C; Mount: Surface Mount
R309 R310 = CMP-250906-155217-1: RES Thin Film,  1kΩ, 1%, 0.1W, 25ppm/°C, 0603
R311 = CMP-26527-002055-1: as R102 on sheet CONN_INPUT; Min Operating Temperature: -55°C; Contact Plating: Tin; Max Operating Temperature: 155°C; Radiation Hardening: No; Tolerance: 5%; RoHS Compliant: Yes; Packaging: Tape and Reel; Mount: Surface Mount; Case/Package: 0603; Resistor Type: Thick Film
T300 = CMP-2000-05323-2: MODULE XFRMR SGL ETHR LAN 16SOIC; Turns Ratio: 1:1; Insertion Loss: -1dB; Isolation Voltage: 1.5kV; DC Resistance (DCR): 1.5R; Return Loss: -12dB; Shielding: Unshielded; Lead/Base Style: Gull Wing; Series: -; Depth: 9.53mm; Radiation Hardening: No; Height - Seated (Max): 6.22mm; Package Quantity: 40; Mount: Surface Mount; Width: 7.11mm; Lead Free: Lead Free; Number of Pins: 16; RoHS Compliant: Yes; Termination: SMD/SMT; Min Operating Temperature: -40°C; Packaging: Rail/Tube; Height: 5.97mm; Case/Package: Module; Max Operating Temperature: 85°C; Length: 12.7mm
TP300 = CMP-1672-00002-4: as TP100 on sheet CONN_INPUT; Contact Material: Bronze; Mounting Technology: Through Hole; RoHSCompliant: true; Pins: 1; Package Quantity: 100; ComponentLink2Description: Datasheet; Height: 8.12 mm; ComponentLink1URL: http://www.keyelco.com/; DatasheetVersion: Rev. F, 12/2013; Mount: Through Hole; PackageReference: 5010; Contact Plating: Silver; Packaging: Bulk; Colour: Red; REACH SVHC: No SVHC; PackageDescription: 1-Pin Through Hole Device, Dia 3.17 mm; ComponentLink2URL: http://www.keyelco.com/product-pdf.cfm?p=1319; ComponentLink1Description: Manufacturer URL
U300 = KSZ8081RNAIA-TR: 1/1 Transceiver Full RMII 24-QFN (4x4); MF: Microchip; SnapEDA_Link: https://www.snapeda.com/parts/KSZ8081RNAIA-TR/Microchip+Technology/view-part/?ref=snap; Package: QFN-24 Microchip; Value: *; MP: KSZ8081RNAIA-TR; Check_prices: https://www.snapeda.com/parts/KSZ8081RNAIA-TR/Microchip+Technology/view-part/?ref=eda
Y300 = C3E-25.000-12-3030-X-R: Package: None; Price: None; Value: *; MP: C3E-25.000-12-3030-X-R; Availability: Unavailable